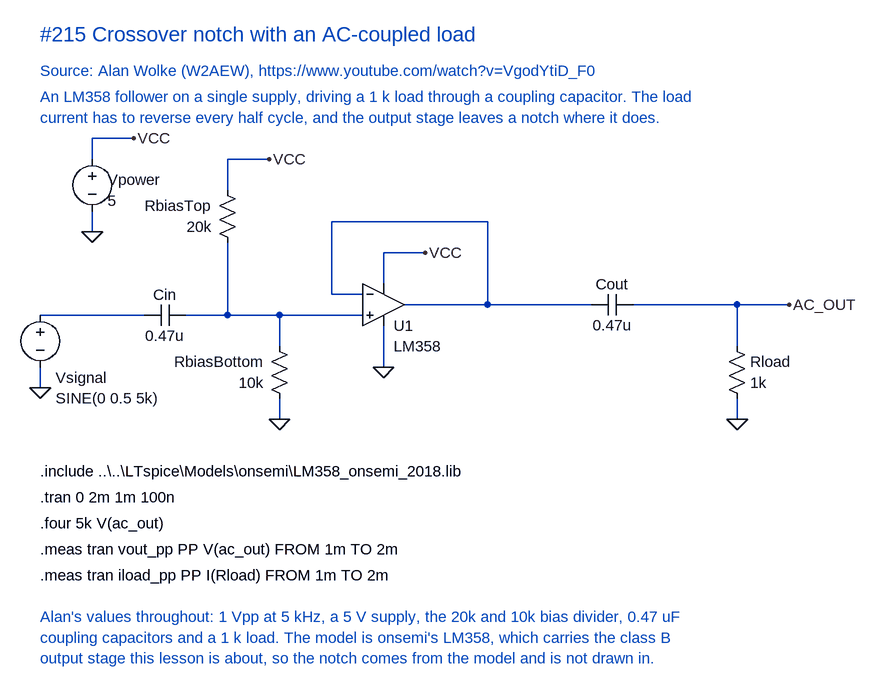
[diagram p0: schematic AC-coupled load and crossover notch.asc]
AC-coupled load and crossover notch.asc, the LTspice schematic file:
Version 4
SHEET 1 1400 800
WIRE 240 464 80 464
WIRE 368 464 304 464
WIRE 576 464 368 464
WIRE 368 464 368 352
WIRE 368 272 368 224
WIRE 368 224 432 224
WIRE 448 464 448 512
WIRE 448 592 448 624
WIRE 160 224 160 192
WIRE 160 192 224 192
WIRE 160 304 160 336
WIRE 80 544 80 576
WIRE 528 432 576 432
WIRE 528 320 528 432
WIRE 768 320 528 320
WIRE 768 448 640 448
WIRE 768 448 768 320
WIRE 928 448 768 448
WIRE 1152 448 992 448
WIRE 1152 448 1232 448
WIRE 1152 512 1152 448
WIRE 1152 592 1152 624
WIRE 608 416 608 368
WIRE 608 368 672 368
WIRE 608 480 608 544
FLAG 80 576 0
FLAG 160 336 0
FLAG 224 192 VCC
FLAG 432 224 VCC
FLAG 448 624 0
FLAG 672 368 VCC
FLAG 608 544 0
FLAG 1152 624 0
FLAG 1232 448 AC_OUT
SYMBOL voltage 80 448 R0
WINDOW 0 24 112 Left 2
WINDOW 3 24 144 Left 2
SYMATTR InstName Vsignal
SYMATTR Value SINE(0 0.5 5k)
SYMBOL voltage 160 208 R0
WINDOW 0 24 48 Left 2
WINDOW 3 24 80 Left 2
SYMATTR InstName Vpower
SYMATTR Value 5
SYMBOL cap 304 448 R90
WINDOW 0 0 32 VBottom 2
WINDOW 3 32 32 VTop 2
SYMATTR InstName Cin
SYMATTR Value 0.47u
SYMBOL res 352 256 R0
WINDOW 0 -8 40 Right 2
WINDOW 3 -8 72 Right 2
SYMATTR InstName RbiasTop
SYMATTR Value 20k
SYMBOL res 432 496 R0
WINDOW 0 -8 40 Right 2
WINDOW 3 -8 72 Right 2
SYMATTR InstName RbiasBottom
SYMATTR Value 10k
SYMBOL Opamps\opamp2 608 384 R0
WINDOW 0 16 96 Left 2
WINDOW 3 16 128 Left 2
SYMATTR InstName U1
SYMATTR Value LM358
SYMBOL cap 992 432 R90
WINDOW 0 0 32 VBottom 2
WINDOW 3 32 32 VTop 2
SYMATTR InstName Cout
SYMATTR Value 0.47u
SYMBOL res 1136 496 R0
WINDOW 0 36 40 Left 2
WINDOW 3 36 72 Left 2
SYMATTR InstName Rload
SYMATTR Value 1k
TEXT 80 32 Left 3 ;#215 Crossover notch with an AC-coupled load
TEXT 80 88 Left 2 ;Source: Alan Wolke (W2AEW), https://www.youtube.com/watch?v=VgodYtiD_F0
TEXT 80 128 Left 2 ;An LM358 follower on a single supply, driving a 1 k load through a coupling capacitor. The load
TEXT 80 160 Left 2 ;current has to reverse every half cycle, and the output stage leaves a notch where it does.
TEXT 80 704 Left 2 !.include ..\..\LTspice\Models\onsemi\LM358_onsemi_2018.lib
TEXT 80 744 Left 2 !.tran 0 2m 1m 100n
TEXT 80 784 Left 2 !.four 5k V(ac_out)
TEXT 80 824 Left 2 !.meas tran vout_pp PP V(ac_out) FROM 1m TO 2m
TEXT 80 864 Left 2 !.meas tran iload_pp PP I(Rload) FROM 1m TO 2m
TEXT 80 928 Left 2 ;Alan's values throughout: 1 Vpp at 5 kHz, a 5 V supply, the 20k and 10k bias divider, 0.47 uF
TEXT 80 960 Left 2 ;coupling capacitors and a 1 k load. The model is onsemi's LM358, which carries the class B
TEXT 80 992 Left 2 ;output stage this lesson is about, so the notch comes from the model and is not drawn in.

The netlist it stands for:
* AC-coupled load and crossover notch.asc
Vsignal N001 0 SINE(0 0.5 5k)
Vpower VCC 0 5
Cin N002 N001 0.47u
RbiasTop VCC N002 20k
RbiasBottom N002 0 10k
XU1 N002 N003 VCC 0 N003 LM358  ; pins In+ In- V+ V- OUT
Cout AC_OUT N003 0.47u
Rload AC_OUT 0 1k
* #215 Crossover notch with an AC-coupled load
* Source: Alan Wolke (W2AEW), https://www.youtube.com/watch?v=VgodYtiD_F0
* An LM358 follower on a single supply, driving a 1 k load through a coupling capacitor. The load
* current has to reverse every half cycle, and the output stage leaves a notch where it does.
.include ..\..\LTspice\Models\onsemi\LM358_onsemi_2018.lib
.tran 0 2m 1m 100n
.four 5k V(ac_out)
.meas tran vout_pp PP V(ac_out) FROM 1m TO 2m
.meas tran iload_pp PP I(Rload) FROM 1m TO 2m
* Alan's values throughout: 1 Vpp at 5 kHz, a 5 V supply, the 20k and 10k bias divider, 0.47 uF
* coupling capacitors and a 1 k load. The model is onsemi's LM358, which carries the class B
* output stage this lesson is about, so the notch comes from the model and is not drawn in.
.backanno
.end